# Altium schematic sheet ChristmasTreeControllerBlockDiagram.SchDoc
size A; SheetNumber: 1; SheetTotal: 5
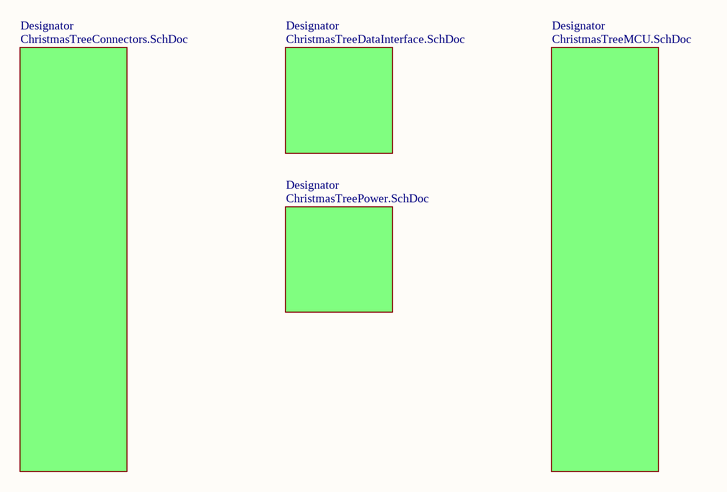
[diagram p0: ChristmasTreeControllerBlockDiagram.SchDoc]

## Sub-sheets
Designator = ChristmasTreeConnectors.SchDoc: no entries
Designator = ChristmasTreeDataInterface.SchDoc: no entries
Designator = ChristmasTreePower.SchDoc: no entries
Designator = ChristmasTreeMCU.SchDoc: no entries